# Altium schematic sheet Connector_Section.SchDoc
size A4; DocumentNumber: 9; SheetNumber: 9; SheetTotal: 9
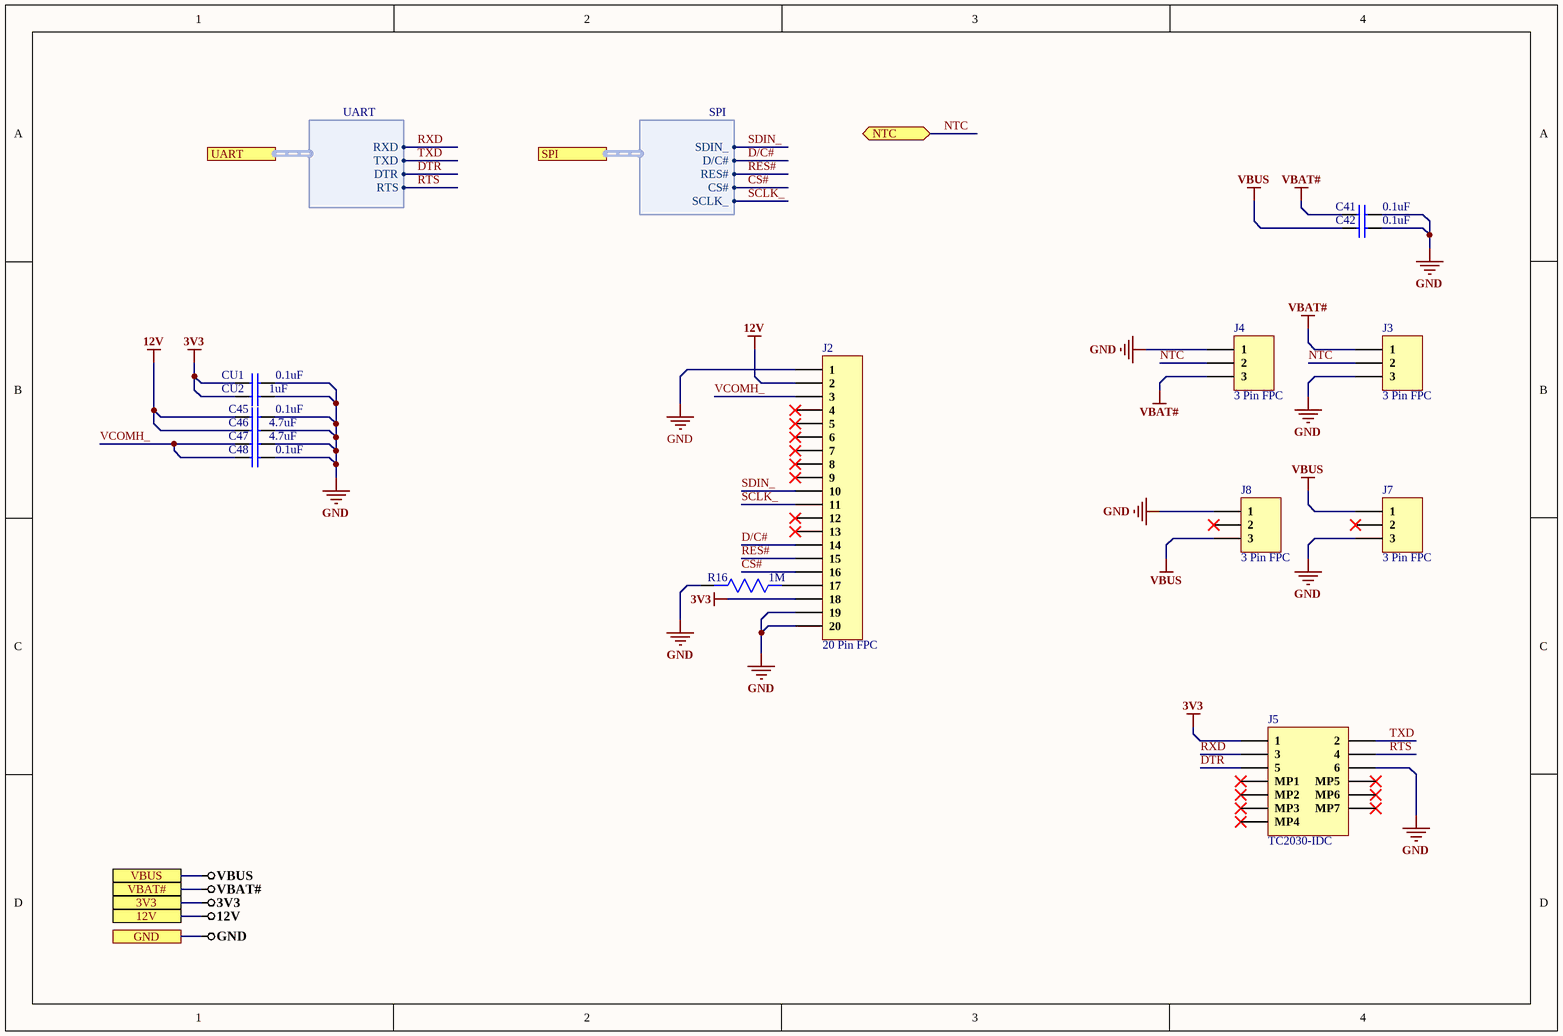
[diagram p0: Connector_Section.SchDoc]

## Parts
C41  0.1uF  [CAP 0201]
C42  0.1uF  [CAP 0201]
C45  0.1uF  [CAP 0201]
C46  4.7uF  [Cap 0402]
C47  4.7uF  [Cap 0402]
C48  0.1uF  [CAP 0201]
CU1  0.1uF  [CAP 0201]
CU2  1uF  [CAP 0201]
J2  20 Pin FPC  [20 Pin FPC]
J3  3 Pin FPC  [3 Pin FPC]
J4  3 Pin FPC  [3 Pin FPC]
J5  TC2030-IDC  [TC2030-IDC]
J7  3 Pin FPC  [3 Pin FPC]
J8  3 Pin FPC  [3 Pin FPC]
R16  1M  [Res-0201]

## Ports
3V3, 12V, GND, NTC (bidir), SPI (harness SPI), UART (harness UART), VBAT#, VBUS

## Harnesses
UART: RXD, TXD, DTR, RTS
SPI: SDIN_, D/C#, RES#, CS#, SCLK_

## Nets
3V3: CU1.1 CU2.1 J2.18 J5.1 ; port 3V3
12V: C45.1 C46.1 J2.2 ; port 12V
GND: C41.2 C42.2 C45.2 C46.2 C47.2 C48.2 CU1.2 CU2.2 J2.1 J2.19 J2.20 J3.3 J4.1 J5.6 J7.3 J8.1 R16.2 ; port GND
VBAT#: C41.1 J3.1 J4.3 ; port VBAT#
VBUS: C42.1 J7.1 J8.3 ; port VBUS
CS#: J2.16 ; port SPI.CS#
D/C#: J2.14 ; port SPI.D/C#
DTR: J5.5 ; port UART.DTR
NTC: J3.2 J4.2 ; port NTC
RES#: J2.15 ; port SPI.RES#
RTS: J5.4 ; port UART.RTS
RXD: J5.3 ; port UART.RXD
SCLK_: J2.11 ; port SPI.SCLK_
SDIN_: J2.10 ; port SPI.SDIN_
TXD: J5.2 ; port UART.TXD
VCOMH_: C47.1 C48.1 J2.3
NetJ2_17: J2.17 R16.1

Not connected (* = marked no-connect by the designer): J2 4* 5* 6* 7* 8* 9* 12* 13*; J5 MP1* MP2* MP3* MP4* MP5* MP6* MP7*; J7 2*; J8 2*

## Library data of the parts
C41 C42 C45 C48 CU1 = GRM033R61E104KE14D: Multilayer Ceramic Capacitors MLCC - SMD/SMT 0201 0.1uF 25volts X5R 10%; Manufacturer: Murata; Capacitance: 100nF; Voltage Rating: 25V; Supplier 1: Mouser; Manufacturer Part Number: GRM033R61E104KE14D; RoHS: Yes; Category: Ceramic Capacitors; Stock 1: 22478; Pricing 1: 1=0.10000, 10=0.03100, 50=0.03100, 100=0.02500, 1000=0.01700, 10000=0.01400 (USD); Mount: Surface Mount; Case/Package: 0201; Case Code (Metric): 0603; Case Code (Imperial): 0201; Weight: 1.2E-05oz; Min Operating Temperature: -55°C; Max Operating Temperature: 85°C; Packaging: Tape and Reel; Tolerance: 10%; Dielectric: X5R; Termination: SMD/SMT; Resistor Type: Ceramic; Voltage Rating (DC): 25V; Package Quantity: 15000; Length: 0.024inch; Width: 0.012inch; Height: 0.3mm; Thickness: 0.013inch; Lead Free: Lead Free; RoHS Compliant: Yes; ComponentLink1URL: http://www.farnell.com/datasheets/2867843.pdf?src-supplier=Farnell; ComponentLink1Description: http://www.farnell.com/datasheets/2867843.pdf?src-supplier=Farnell; ComponentLink2URL: http://www.mouser.com/ds/2/281/c02e-2905.pdf?src-supplier=Mouser; ComponentLink2Description: http://www.mouser.com/ds/2/281/c02e-2905.pdf?src-supplier=Mouser; ComponentLink3URL: http://search.murata.co.jp/Ceramy/image/img/A01X/G101/ENG/GRM033R61E104KE14-01.pdf?src-supplier=Digi-Key; ComponentLink3Description: http://search.murata.co.jp/Ceramy/image/img/A01X/G101/ENG/GRM033R61E104KE14-01.pdf?src-supplier=Digi-Key; ComponentLink4URL: http://www.farnell.com/datasheets/2867843.pdf?src-supplier=Newark; ComponentLink4Description: http://www.farnell.com/datasheets/2867843.pdf?src-supplier=Newark; Supplier Part Number 1: 81-GRM033R61E104KE4D
C46 C47 = CL05A475MO5NUNC: Cap Ceramic 4.7uF 16V X5R 20% SMD 0402 85C T/R; Manufacturer: Samsung; Supplier 1: Avnet; Manufacturer Part Number: CL05A475MO5NUNC; RoHS: Yes; Category: Ceramic Capacitors; Pricing 1: 1=0.63800, 25=0.44600, 100=0.26800, 250=0.23400, 500=0.20000, 1000=0.16900 (USD); Mount: Surface Mount; Case/Package: 0402; Case Code (Metric): 1005; Case Code (Imperial): 0402; Min Operating Temperature: -55°C; Max Operating Temperature: 85°C; Packaging: Tape and Reel; Capacitance: 4.7uF; Voltage Rating: 16V; Tolerance: 20%; Length: 0.039inch; Width: 0.02inch; Thickness: 0.022inch; RoHS Compliant: Yes; ComponentLink1URL: http://www.farnell.com/datasheets/2710653.pdf?src-supplier=Farnell; ComponentLink1Description: http://www.farnell.com/datasheets/2710653.pdf?src-supplier=Farnell; ComponentLink2URL: http://www.farnell.com/datasheets/2710653.pdf?src-supplier=Newark; ComponentLink2Description: http://www.farnell.com/datasheets/2710653.pdf?src-supplier=Newark; ComponentLink3URL: http://www.samsungsem.com/kr/support/product-search/mlcc/CL05A475MO5NUNC.jsp?src-supplier=Digi-Key; ComponentLink3Description: http://www.samsungsem.com/kr/support/product-search/mlcc/CL05A475MO5NUNC.jsp?src-supplier=Digi-Key; Supplier Part Number 1: 82AC9197
CU2 = CL03A105MO3NRNC: Mlcc 0201 X5R1UF16V 20% T: 0.39MM; Manufacturer: Samsung; Supplier 1: Avnet; Manufacturer Part Number: CL03A105MO3NRNC; RoHS: Yes; Category: Ceramic Capacitors; Pricing 1: 100000=0.02840, 120000=0.02800, 220000=0.02720, 500000=0.02660, 1000000=0.02560, 5000000=0.02500, 10000000=0.02440 (USD); RoHS Compliant: Yes; Supplier Part Number 1: CL03A105MO3NRNC
J2 = 20 Pin FPC: CONN FPC 20POS 0.5MM SMD R/A
J3 J4 J7 J8 = 3 Pin FPC: CONN FPC 3POS 0.5MM SMD R/A; ComponentLink1URL: https://www.molex.com/pdm_docs/pk/5051479200-200.pdf?src-supplier=Digi-Key; ComponentLink1Description: https://www.molex.com/pdm_docs/pk/5051479200-200.pdf?src-supplier=Digi-Key; ComponentLink2URL: http://www.molex.com/pdm_docs/sd/5051470390_sd.pdf?src-supplier=Digi-Key; ComponentLink2Description: http://www.molex.com/pdm_docs/sd/5051470390_sd.pdf?src-supplier=Digi-Key; ComponentLink3URL: https://www.molex.com/pdm_docs/sd/5051470390_sd.pdf?src-supplier=Digi-Key; ComponentLink3Description: https://www.molex.com/pdm_docs/sd/5051470390_sd.pdf?src-supplier=Digi-Key
J5 = TC2030-IDC: CABLE ADAPTER 6 POS; Manufacturer: Tag-Connect; ComponentLink1URL: http://www.tag-connect.com/Materials/TC2030-MCP%20Datasheet.pdf?src-supplier=Digi-Key; ComponentLink1Description: http://www.tag-connect.com/Materials/TC2030-MCP%20Datasheet.pdf?src-supplier=Digi-Key; Supplier 1: Digi-Key; Manufacturer Part Number: TC2030-IDC; Stock 1: 284; Pricing 1: 1=43.71 (USD); Package Quantity: 1; Supplier Part Number 1: TC2030-IDC-ND
R16 = WR02X105JAL: Res Thick Film 0201 1M Ohm 5% 0.05W(1/20W) ±200ppm/C Molded SMD Paper T/R; Manufacturer: Walsin Technologies; Resistance: 1MR; Supplier 1: Digi-Key; Manufacturer Part Number: WR02X105JAL; RoHS: Yes; Category: Uncategorized; Stock 1: 6920; Pricing 1: 1=0.10000, 10=0.01800, 100=0.00750, 1000=0.00335, 2500=0.00291, 5000=0.00240 (USD); Case/Package: 0201; Min Operating Temperature: -55°C; Max Operating Temperature: 125°C; Resistor Type: Thick Film; Tolerance: 5%; Packaging: Tape and Reel; Length: 0.6mm; Depth: 0.3mm; Military Standard: Not; ComponentLink1URL: http://components.arrow.com/part/dataview/0323_00666329?src-supplier=Arrow+Europe; ComponentLink1Description: http://components.arrow.com/part/dataview/0323_00666329?src-supplier=Arrow+Europe; Supplier Part Number 1: 1292-WR02X105JALCT-ND